# Altium schematic sheet Oscilloscope Interface.SchDoc
size 406 x 304 mm; SheetNumber: 8; SheetTotal: 9
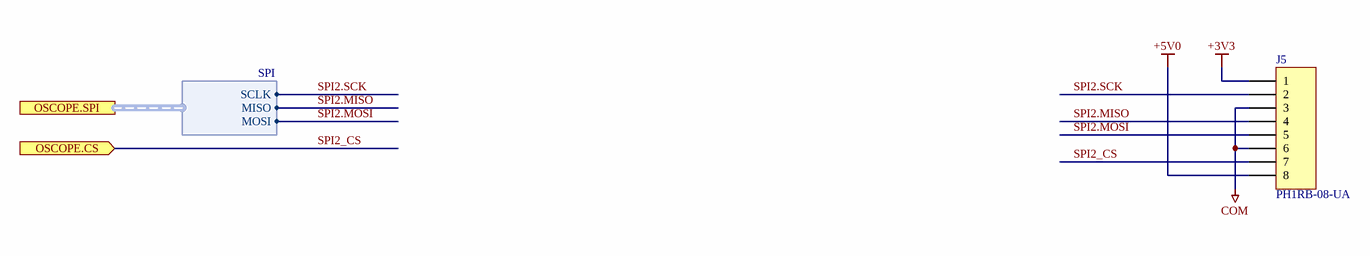
[diagram p0: Oscilloscope Interface.SchDoc]

## Parts
J5  PH1RB-08-UA  [ADAMTECH_PH1RB-08-UA]

## Ports
OSCOPE.CS (in), OSCOPE.SPI (harness SPI)

## Harnesses
SPI: SCLK, MISO, MOSI

## Nets
+3V3: J5.1
+5V0: J5.8
COM: J5.3 J5.6
SPI2.MISO: J5.4 ; port OSCOPE.SPI.MISO
SPI2.MOSI: J5.5 ; port OSCOPE.SPI.MOSI
SPI2.SCK: J5.2 ; port OSCOPE.SPI.SCLK
SPI2_CS: J5.7 ; port OSCOPE.CS

## Notes on the sheet
- Sheet Name:
- Date:
- Sheet
- Designer:
- of

## Library data of the parts
J5 = Term,Header,1x8 Pin,2.54mm,Right,Thru: Connector Header Through Hole, Right Angle 8 position 0.100" (2.54mm); Manufacturer 1: Adam Tech; Vendor 1 Part Number: 2057-PH1RB-08-UA-ND; Vendor 1: Digikey; Part Name: Term,Header,1x8 Pin,2.54mm,Right,Thru; CreatedBy: Judd Foster; HelpURL: https://app.adam-tech.com/products/download/data_sheet/201281/ph1rb-xx-ua-data-sheet.pdf; Manufacturer 1 Part Number: PH1RB-08-UA